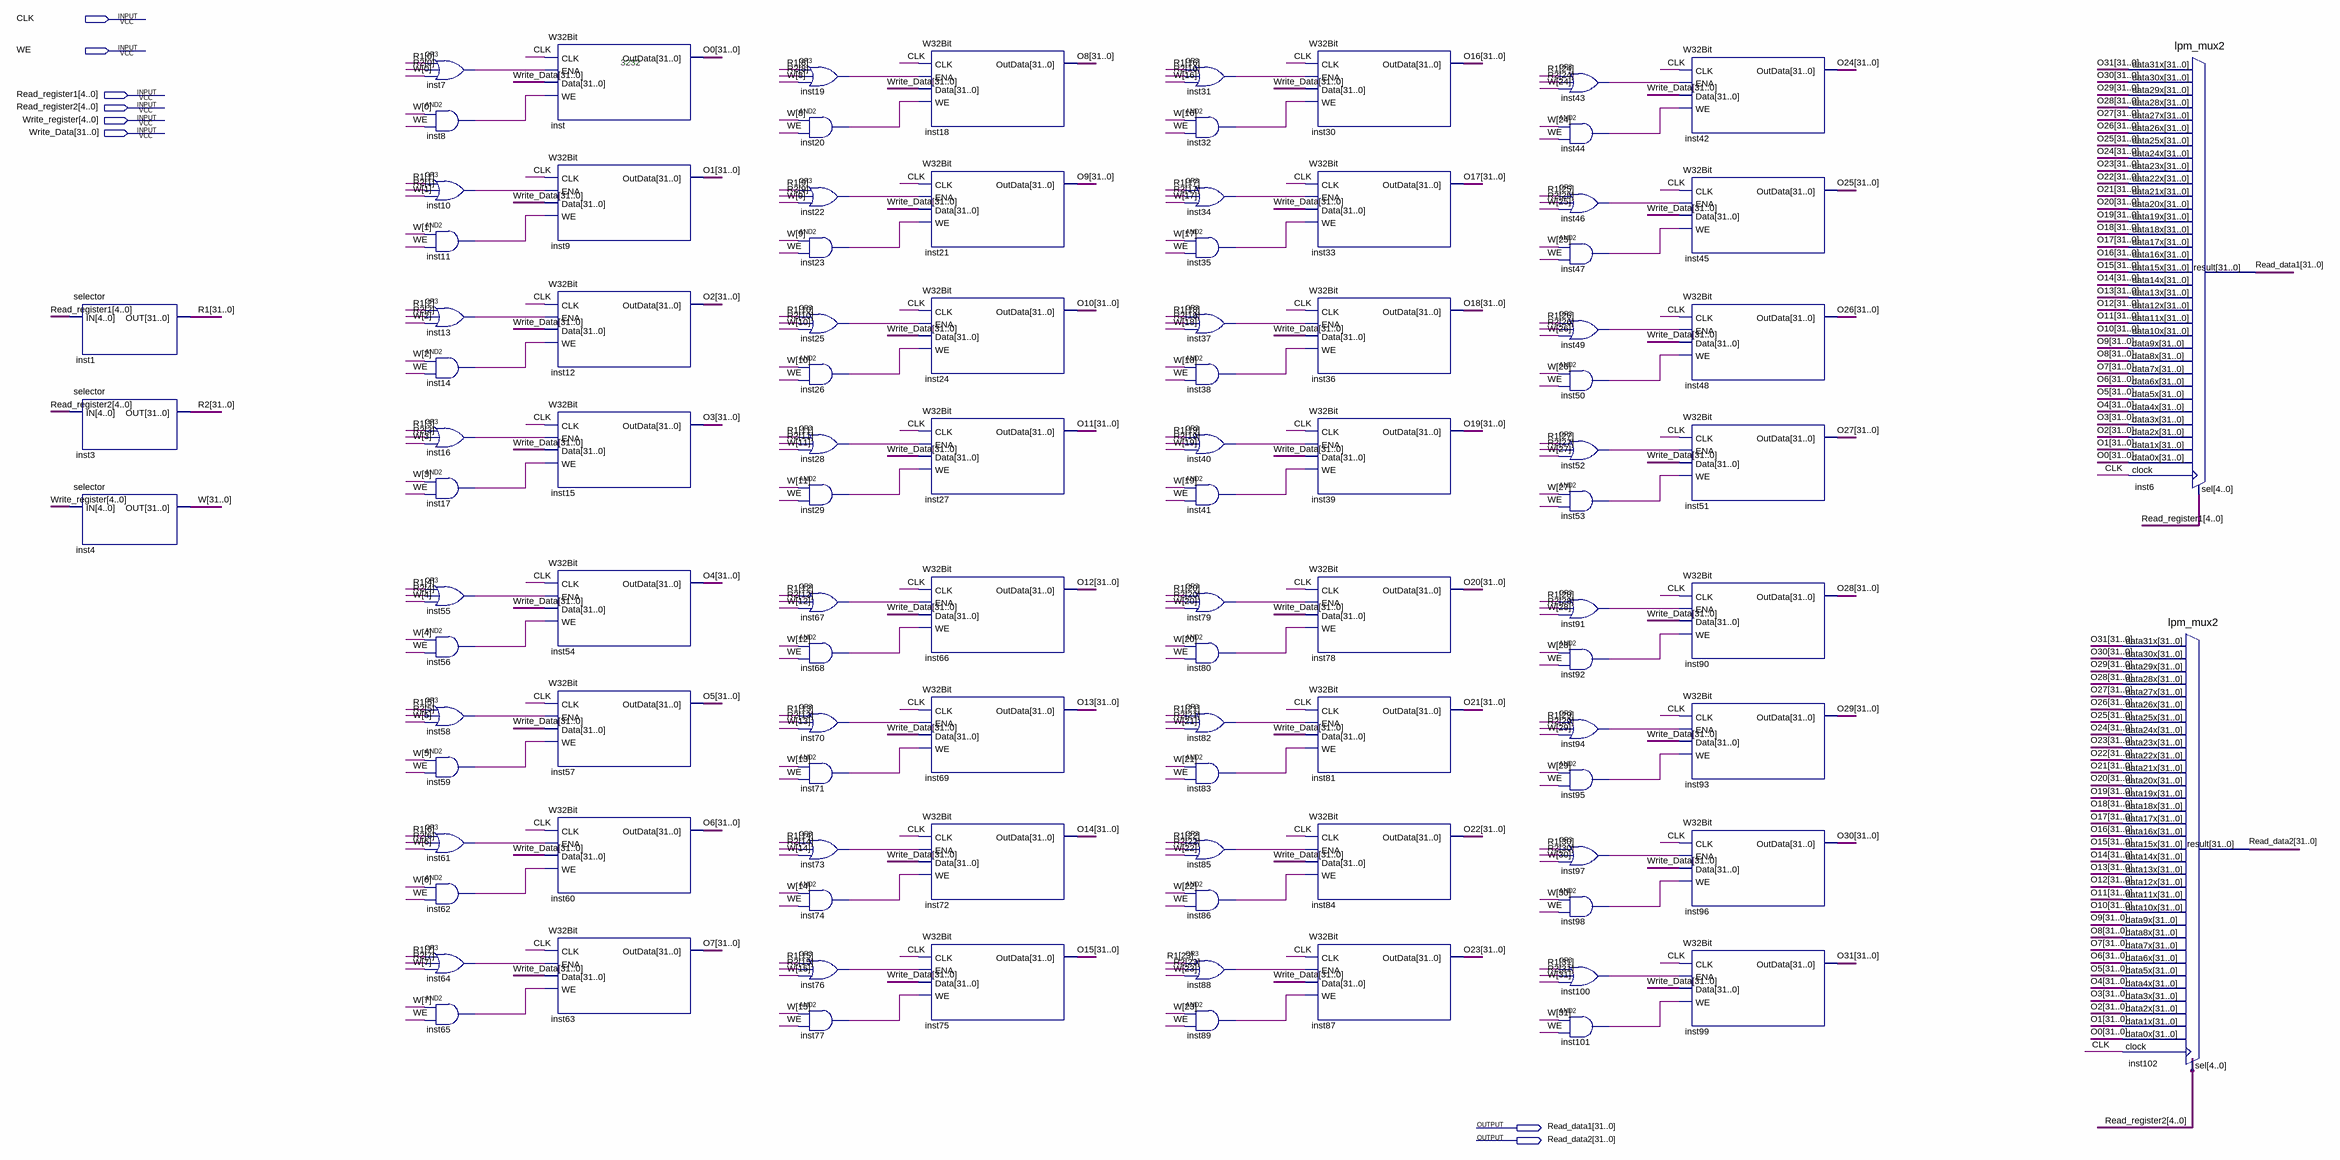
[diagram p0: schematic sheet]
// Quartus schematic test3232.bdf as structural Verilog: 101 symbols, 8 pins
module test3232 (
  input  CLK,
  input  WE,
  input  [4:0] Read_register1,
  input  [4:0] Read_register2,
  input  [4:0] Write_register,
  input  [31:0] Write_Data,
  output [31:0] Read_data1,
  output [31:0] Read_data2
);

  wire inst7_out, inst8_out, inst10_out, inst11_out, inst13_out, inst14_out, inst16_out, inst17_out,
       inst19_out, inst20_out, inst22_out, inst23_out, inst25_out, inst26_out, inst28_out, inst29_out,
       inst31_out, inst32_out, inst34_out, inst35_out, inst37_out, inst38_out, inst40_out, inst41_out,
       inst43_out, inst44_out, inst46_out, inst47_out, inst49_out, inst50_out, inst52_out, inst53_out,
       inst55_out, inst56_out, inst58_out, inst59_out, inst61_out, inst62_out, inst64_out, inst65_out,
       inst67_out, inst68_out, inst70_out, inst71_out, inst73_out, inst74_out, inst76_out, inst77_out,
       inst79_out, inst80_out, inst82_out, inst83_out, inst85_out, inst86_out, inst88_out, inst89_out,
       inst91_out, inst92_out, inst94_out, inst95_out, inst97_out, inst98_out, inst100_out, inst101_out;
  wire [31:0] O0, O1, O2, O3, O4, O5, O6, O7, O8, O9, O10, O11, O12, O13, O14, O15, O16, O17, O18, O19, O20,
       O21, O22, O23, O24, O25, O26, O27, O28, O29, O30, O31, R1, R2, W;

  selector inst1 (.IN(Read_register1), .OUT(R1));
  selector inst3 (.IN(Read_register2), .OUT(R2));
  selector inst4 (.IN(Write_register), .OUT(W));
  or inst7 (inst7_out, R1[0], R2[0], W[0]);
  and inst8 (inst8_out, W[0], WE);
  or inst10 (inst10_out, R1[1], R2[1], W[1]);
  and inst11 (inst11_out, W[1], WE);
  or inst13 (inst13_out, R1[2], R2[2], W[2]);
  and inst14 (inst14_out, W[2], WE);
  or inst16 (inst16_out, R1[3], R2[3], W[3]);
  and inst17 (inst17_out, W[3], WE);
  or inst55 (inst55_out, R1[4], R2[4], W[4]);
  and inst56 (inst56_out, W[4], WE);
  or inst58 (inst58_out, R1[5], R2[5], W[5]);
  and inst59 (inst59_out, W[5], WE);
  or inst61 (inst61_out, R1[6], R2[6], W[6]);
  and inst62 (inst62_out, W[6], WE);
  or inst64 (inst64_out, R1[7], R2[7], W[7]);
  and inst65 (inst65_out, W[7], WE);
  W32Bit inst (.CLK(CLK), .ENA(inst7_out), .Data(Write_Data), .WE(inst8_out), .OutData(O0));
  W32Bit inst9 (.CLK(CLK), .ENA(inst10_out), .Data(Write_Data), .WE(inst11_out), .OutData(O1));
  W32Bit inst12 (.CLK(CLK), .ENA(inst13_out), .Data(Write_Data), .WE(inst14_out), .OutData(O2));
  W32Bit inst15 (.CLK(CLK), .ENA(inst16_out), .Data(Write_Data), .WE(inst17_out), .OutData(O3));
  W32Bit inst54 (.CLK(CLK), .ENA(inst55_out), .Data(Write_Data), .WE(inst56_out), .OutData(O4));
  W32Bit inst57 (.CLK(CLK), .ENA(inst58_out), .Data(Write_Data), .WE(inst59_out), .OutData(O5));
  W32Bit inst60 (.CLK(CLK), .ENA(inst61_out), .Data(Write_Data), .WE(inst62_out), .OutData(O6));
  W32Bit inst63 (.CLK(CLK), .ENA(inst64_out), .Data(Write_Data), .WE(inst65_out), .OutData(O7));
  or inst19 (inst19_out, R1[8], R2[8], W[8]);
  and inst20 (inst20_out, W[8], WE);
  or inst22 (inst22_out, R1[9], R2[9], W[9]);
  and inst23 (inst23_out, W[9], WE);
  or inst25 (inst25_out, R1[10], R2[10], W[10]);
  and inst26 (inst26_out, W[10], WE);
  or inst28 (inst28_out, R1[11], R2[11], W[11]);
  and inst29 (inst29_out, W[11], WE);
  or inst67 (inst67_out, R1[12], R2[12], W[12]);
  and inst68 (inst68_out, W[12], WE);
  or inst70 (inst70_out, R1[13], R2[13], W[13]);
  and inst71 (inst71_out, W[13], WE);
  or inst73 (inst73_out, R1[14], R2[14], W[14]);
  and inst74 (inst74_out, W[14], WE);
  or inst76 (inst76_out, R1[15], R2[15], W[15]);
  and inst77 (inst77_out, W[15], WE);
  W32Bit inst18 (.CLK(CLK), .ENA(inst19_out), .Data(Write_Data), .WE(inst20_out), .OutData(O8));
  W32Bit inst21 (.CLK(CLK), .ENA(inst22_out), .Data(Write_Data), .WE(inst23_out), .OutData(O9));
  W32Bit inst24 (.CLK(CLK), .ENA(inst25_out), .Data(Write_Data), .WE(inst26_out), .OutData(O10));
  W32Bit inst27 (.CLK(CLK), .ENA(inst28_out), .Data(Write_Data), .WE(inst29_out), .OutData(O11));
  W32Bit inst66 (.CLK(CLK), .ENA(inst67_out), .Data(Write_Data), .WE(inst68_out), .OutData(O12));
  W32Bit inst69 (.CLK(CLK), .ENA(inst70_out), .Data(Write_Data), .WE(inst71_out), .OutData(O13));
  W32Bit inst72 (.CLK(CLK), .ENA(inst73_out), .Data(Write_Data), .WE(inst74_out), .OutData(O14));
  W32Bit inst75 (.CLK(CLK), .ENA(inst76_out), .Data(Write_Data), .WE(inst77_out), .OutData(O15));
  or inst31 (inst31_out, R1[16], R2[16], W[16]);
  and inst32 (inst32_out, W[16], WE);
  or inst34 (inst34_out, R1[17], R2[17], W[17]);
  and inst35 (inst35_out, W[17], WE);
  or inst37 (inst37_out, R1[18], R2[18], W[18]);
  and inst38 (inst38_out, W[18], WE);
  or inst40 (inst40_out, R1[19], R2[19], W[19]);
  and inst41 (inst41_out, W[19], WE);
  or inst79 (inst79_out, R1[20], R2[20], W[20]);
  and inst80 (inst80_out, W[20], WE);
  or inst82 (inst82_out, R1[21], R2[21], W[21]);
  and inst83 (inst83_out, W[21], WE);
  or inst85 (inst85_out, R1[22], R2[22], W[22]);
  and inst86 (inst86_out, W[22], WE);
  or inst88 (inst88_out, R1[23], R2[23], W[23]);
  and inst89 (inst89_out, W[23], WE);
  W32Bit inst30 (.CLK(CLK), .ENA(inst31_out), .Data(Write_Data), .WE(inst32_out), .OutData(O16));
  W32Bit inst33 (.CLK(CLK), .ENA(inst34_out), .Data(Write_Data), .WE(inst35_out), .OutData(O17));
  W32Bit inst36 (.CLK(CLK), .ENA(inst37_out), .Data(Write_Data), .WE(inst38_out), .OutData(O18));
  W32Bit inst39 (.CLK(CLK), .ENA(inst40_out), .Data(Write_Data), .WE(inst41_out), .OutData(O19));
  W32Bit inst78 (.CLK(CLK), .ENA(inst79_out), .Data(Write_Data), .WE(inst80_out), .OutData(O20));
  W32Bit inst81 (.CLK(CLK), .ENA(inst82_out), .Data(Write_Data), .WE(inst83_out), .OutData(O21));
  W32Bit inst84 (.CLK(CLK), .ENA(inst85_out), .Data(Write_Data), .WE(inst86_out), .OutData(O22));
  W32Bit inst87 (.CLK(CLK), .ENA(inst88_out), .Data(Write_Data), .WE(inst89_out), .OutData(O23));
  or inst43 (inst43_out, R1[24], R2[24], W[24]);
  and inst44 (inst44_out, W[24], WE);
  or inst46 (inst46_out, R1[25], R2[25], W[25]);
  and inst47 (inst47_out, W[25], WE);
  or inst49 (inst49_out, R1[26], R2[26], W[26]);
  and inst50 (inst50_out, W[26], WE);
  or inst52 (inst52_out, R1[27], R2[27], W[27]);
  and inst53 (inst53_out, W[27], WE);
  or inst91 (inst91_out, R1[28], R2[28], W[28]);
  and inst92 (inst92_out, W[28], WE);
  or inst94 (inst94_out, R1[29], R2[29], W[29]);
  and inst95 (inst95_out, W[29], WE);
  or inst97 (inst97_out, R1[30], R2[30], W[30]);
  and inst98 (inst98_out, W[30], WE);
  or inst100 (inst100_out, R1[31], R2[31], W[31]);
  and inst101 (inst101_out, W[31], WE);
  W32Bit inst42 (.CLK(CLK), .ENA(inst43_out), .Data(Write_Data), .WE(inst44_out), .OutData(O24));
  W32Bit inst45 (.CLK(CLK), .ENA(inst46_out), .Data(Write_Data), .WE(inst47_out), .OutData(O25));
  W32Bit inst48 (.CLK(CLK), .ENA(inst49_out), .Data(Write_Data), .WE(inst50_out), .OutData(O26));
  W32Bit inst51 (.CLK(CLK), .ENA(inst52_out), .Data(Write_Data), .WE(inst53_out), .OutData(O27));
  W32Bit inst90 (.CLK(CLK), .ENA(inst91_out), .Data(Write_Data), .WE(inst92_out), .OutData(O28));
  W32Bit inst93 (.CLK(CLK), .ENA(inst94_out), .Data(Write_Data), .WE(inst95_out), .OutData(O29));
  W32Bit inst96 (.CLK(CLK), .ENA(inst97_out), .Data(Write_Data), .WE(inst98_out), .OutData(O30));
  W32Bit inst99 (.CLK(CLK), .ENA(inst100_out), .Data(Write_Data), .WE(inst101_out), .OutData(O31));
  lpm_mux2 inst6 (
    .data31x(O31), .data30x(O30), .data29x(O29), .data28x(O28), .data27x(O27), .data26x(O26), .data25x(O25),
    .data24x(O24), .data23x(O23), .data22x(O22), .data21x(O21), .data20x(O20), .data19x(O19), .data18x(O18),
    .data17x(O17), .data16x(O16), .data15x(O15), .data14x(O14), .data13x(O13), .data12x(O12), .data11x(O11),
    .data10x(O10), .data9x(O9), .data8x(O8), .data7x(O7), .data6x(O6), .data5x(O5), .data4x(O4), .data3x(O3),
    .data2x(O2), .data1x(O1), .data0x(O0), .clock(CLK), .sel(Read_register1), .result(Read_data1));
  lpm_mux2 inst102 (
    .data31x(O31), .data30x(O30), .data29x(O29), .data28x(O28), .data27x(O27), .data26x(O26), .data25x(O25),
    .data24x(O24), .data23x(O23), .data22x(O22), .data21x(O21), .data20x(O20), .data19x(O19), .data18x(O18),
    .data17x(O17), .data16x(O16), .data15x(O15), .data14x(O14), .data13x(O13), .data12x(O12), .data11x(O11),
    .data10x(O10), .data9x(O9), .data8x(O8), .data7x(O7), .data6x(O6), .data5x(O5), .data4x(O4), .data3x(O3),
    .data2x(O2), .data1x(O1), .data0x(O0), .clock(CLK), .sel(Read_register2), .result(Read_data2));

  // Notes on the sheet:
  //   3232
endmodule
